# Altium schematic sheet ESP32-S3.SchDoc
size A3; SheetNumber: 2; SheetTotal: 12
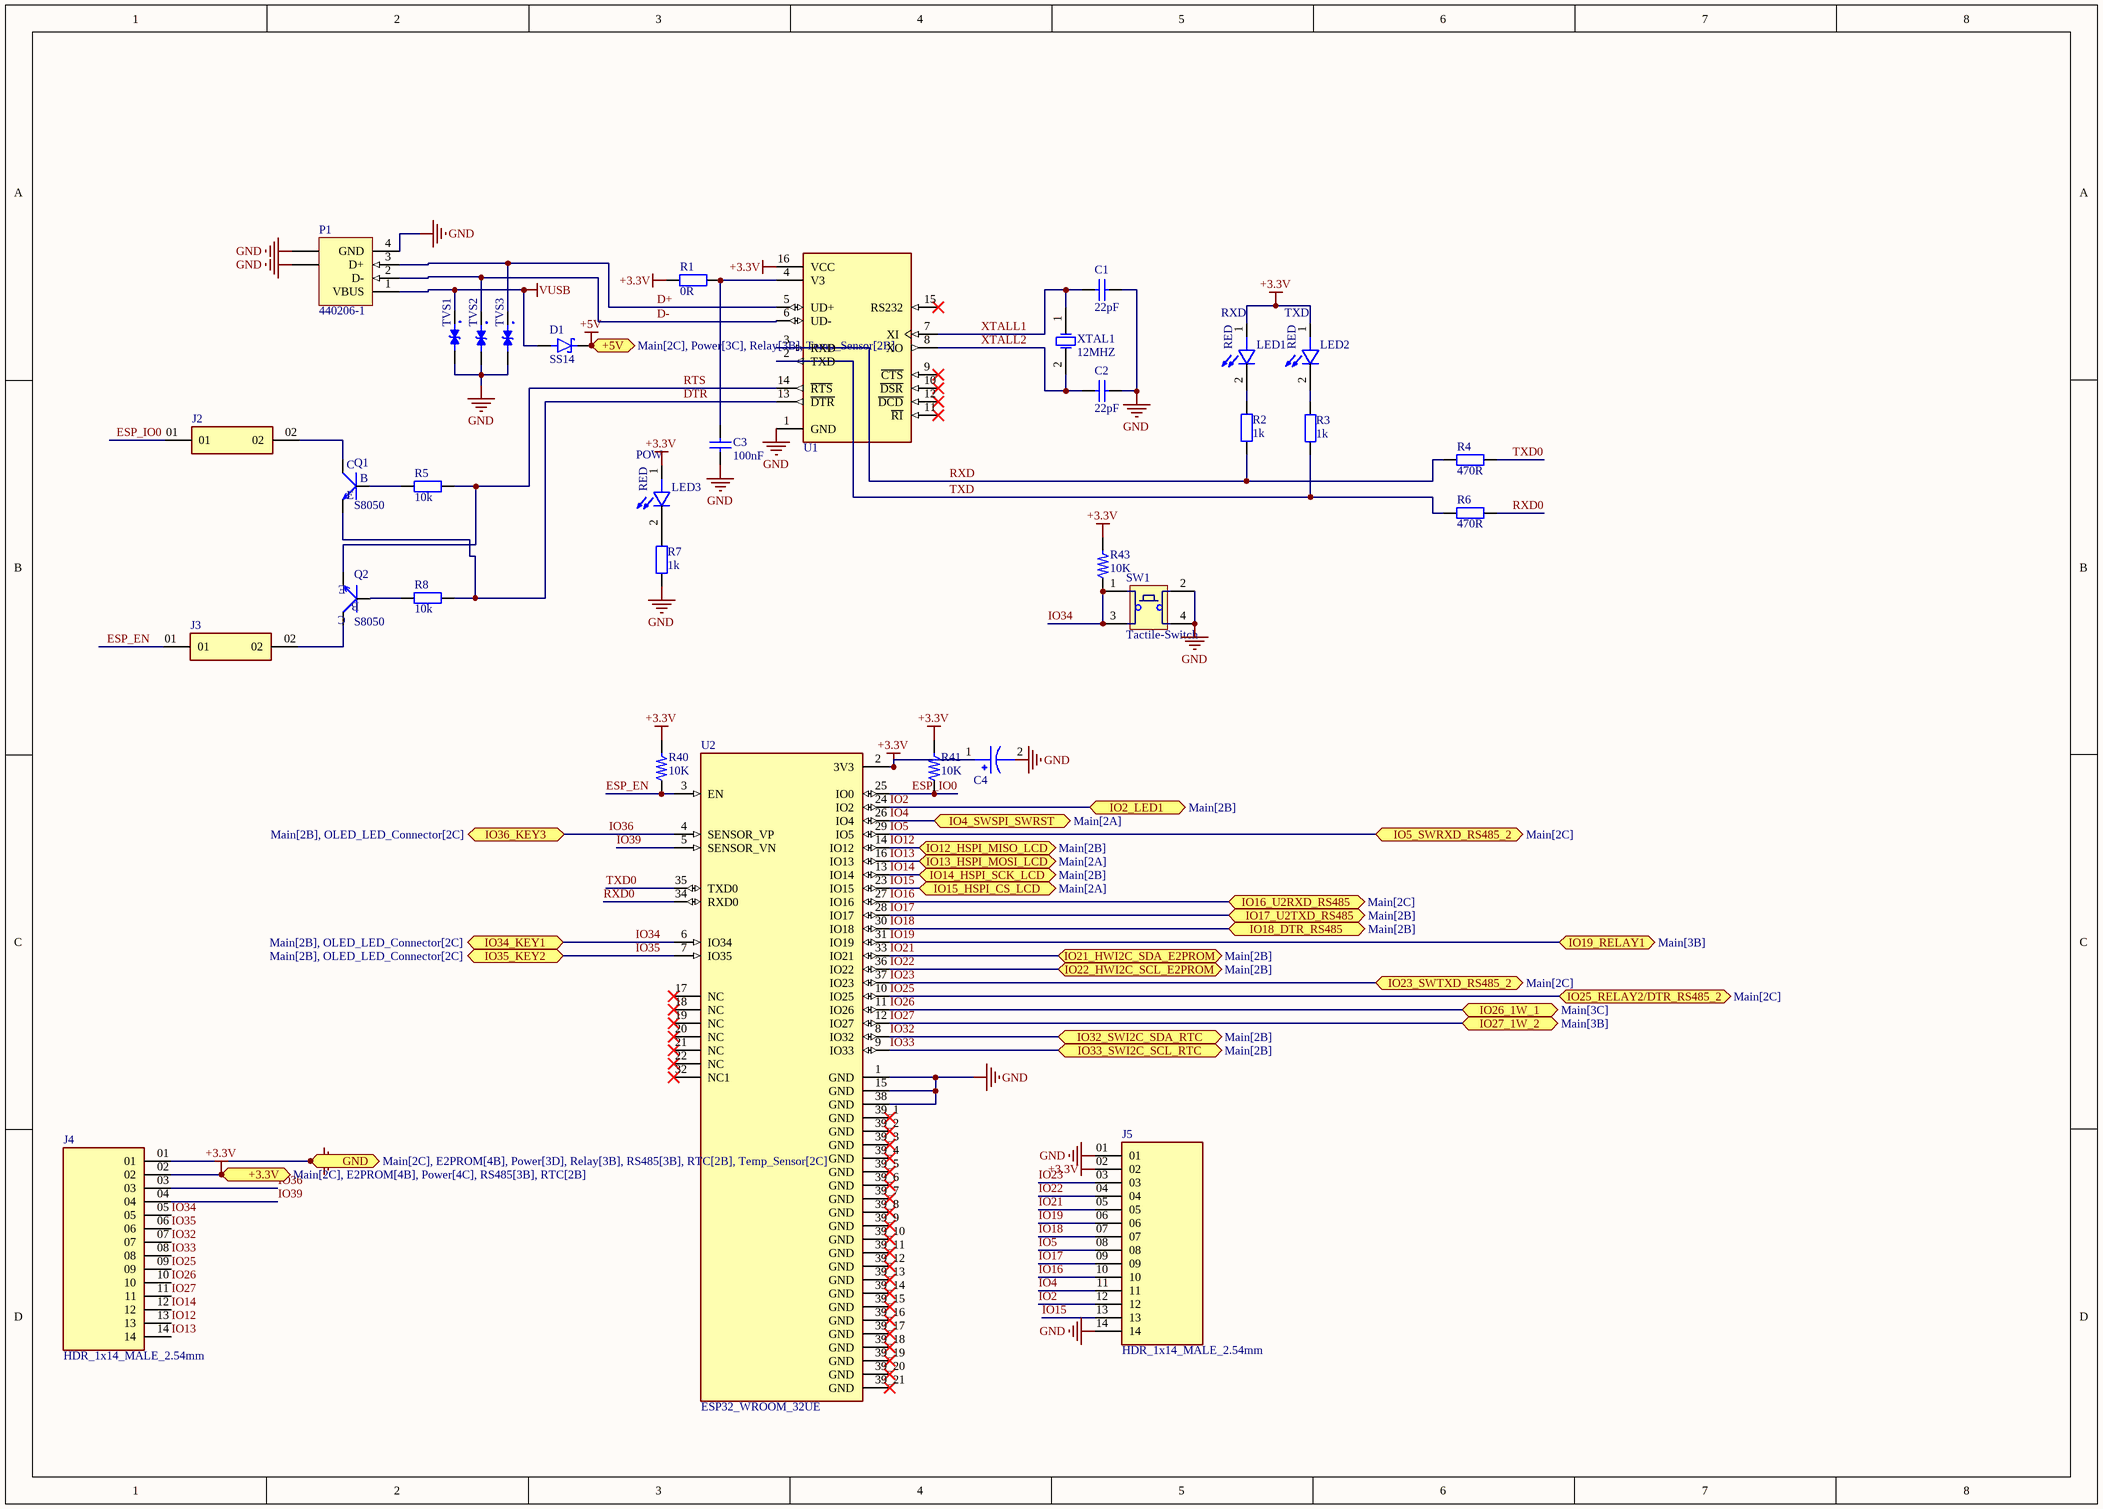
[diagram p0: ESP32-S3.SchDoc]

## Parts
C1  22pF  [0805]
C2  22pF  [0805]
C3  100nF  [0805]
C4  100uf 10V TAN  [TAN_SIZE_A]  (value not drawn)
D1  SS14  [SS14]
J2  HDR_1x2_MALE_2.54mm  [HDR_1x2_MALE_2.54mm]  (value not drawn)
J3  HDR_1x2_MALE_2.54mm  [HDR_1x2_MALE_2.54mm]  (value not drawn)
J4  HDR_1x14_MALE_2.54mm  [HDR_1x14_MALE_2.54mm]
J5  HDR_1x14_MALE_2.54mm  [HDR_1x14_MALE_2.54mm]
LED1  RXD  [LED-0805-G]
LED2  TXD  [LED-0805-G]
LED3  POW  [LED-0805-G]
P1  440206-1  [USB]
Q1  S8050  [S8050]
Q2  S8050  [S8050]
R1  0R  [R0805]
R2  1k  [R0805]
R3  1k  [R0805]
R4  470R  [R0805]
R5  10k  [R0805]
R6  470R  [R0805]
R7  1k  [R0805]
R8  10k  [R0805]
R40  10K  [R0805]
R41  10K  [R0805]
R43  10K  [R0805]
SW1  Tactile-Switch  [SW-Tactile-SMD]
TVS1  LESD5D5.0CT1G  [TVS]  (value not drawn)
TVS2  LESD5D5.0CT1G  [TVS]  (value not drawn)
TVS3  LESD5D5.0CT1G  [TVS]  (value not drawn)
U1  CH340G  [CH340G]  (value not drawn)
U2  ESP32_WROOM_32UE  [ESP32_WROOM_32UE(M113EH6400UH3Q0)]
XTAL1  12MHZ  [XTAL-1]

## Ports
+3.3V (bidir, see Main[2C], E2PROM[4B], Power[4C], RS485[3B], RTC[2B]), +5V (bidir, see Main[2C], Power[3C], Relay[3B], Temp_Sensor[2B]), GND (bidir, see Main[2C], E2PROM[4B], Power[3D], Relay[3B], RS485[3B], RTC[2B], Temp_Sensor[2C]), IO2_LED1 (bidir, see Main[2B]), IO4_SWSPI_SWRST (bidir, see Main[2A]), IO5_SWRXD_RS485_2 (bidir, see Main[2C]), IO12_HSPI_MISO_LCD (bidir, see Main[2B]), IO13_HSPI_MOSI_LCD (bidir, see Main[2A]), IO14_HSPI_SCK_LCD (bidir, see Main[2B]), IO15_HSPI_CS_LCD (bidir, see Main[2A]), IO16_U2RXD_RS485 (bidir, see Main[2C]), IO17_U2TXD_RS485 (bidir, see Main[2B]), IO18_DTR_RS485 (bidir, see Main[2B]), IO19_RELAY1 (bidir, see Main[3B]), IO21_HWI2C_SDA_E2PROM (bidir, see Main[2B]), IO22_HWI2C_SCL_E2PROM (bidir, see Main[2B]), IO23_SWTXD_RS485_2 (bidir, see Main[2C]), IO25_RELAY2/DTR_RS485_2 (bidir, see Main[2C]), IO26_1W_1 (bidir, see Main[3C]), IO27_1W_2 (bidir, see Main[3B]), IO32_SWI2C_SDA_RTC (bidir, see Main[2B]), IO33_SWI2C_SCL_RTC (bidir, see Main[2B]), IO34_KEY1 (bidir, see Main[2B], OLED_LED_Connector[2C]), IO35_KEY2 (bidir, see Main[2B], OLED_LED_Connector[2C]), IO36_KEY3 (bidir, see Main[2B], OLED_LED_Connector[2C])

## Nets
+3.3V: C4.1 J4.02 J5.02 LED1.1 LED2.1 LED3.1 R1.1 R40.2 R41.2 R43.2 U1.16(VCC) U2.2(3V3) ; port +3.3V
+5V: D1.C(K) ; port +5V
GND: C1.1 C2.1 C3.1 C4.2 J4.01 J5.01 J5.14 P1.4(GND) P1.5(SHLD) P1.6(SHLD) R7.2 SW1.2 SW1.4 TVS1.2 TVS2.2 TVS3.2 U1.1(GND) U2.1(GND) U2.15(GND) U2.38(GND) ; port GND
VUSB: D1.A P1.1(VBUS) TVS1.1
D+: P1.3(D+) TVS3.1 U1.5(UD+)
D-: P1.2(D-) TVS2.1 U1.6(UD-)
DTR: Q1.2(E) R8.1 U1.13(~{DTR})
ESP_EN: J3.01 R40.1 U2.3(EN)
ESP_IO0: J2.01 R41.1 U2.25(IO0)
IO2: J5.12 U2.24(IO2) ; port IO2_LED1
IO4: J5.11 U2.26(IO4) ; port IO4_SWSPI_SWRST
IO5: J5.08 U2.29(IO5) ; port IO5_SWRXD_RS485_2
IO12: J4.13 U2.14(IO12) ; port IO12_HSPI_MISO_LCD
IO13: J4.14 U2.16(IO13) ; port IO13_HSPI_MOSI_LCD
IO14: J4.12 U2.13(IO14) ; port IO14_HSPI_SCK_LCD
IO15: J5.13 U2.23(IO15) ; port IO15_HSPI_CS_LCD
IO16: J5.10 U2.27(IO16) ; port IO16_U2RXD_RS485
IO17: J5.09 U2.28(IO17) ; port IO17_U2TXD_RS485
IO18: J5.07 U2.30(IO18) ; port IO18_DTR_RS485
IO19: J5.06 U2.31(IO19) ; port IO19_RELAY1
IO21: J5.05 U2.33(IO21) ; port IO21_HWI2C_SDA_E2PROM
IO22: J5.04 U2.36(IO22) ; port IO22_HWI2C_SCL_E2PROM
IO23: J5.03 U2.37(IO23) ; port IO23_SWTXD_RS485_2
IO25: J4.09 U2.10(IO25) ; port IO25_RELAY2/DTR_RS485_2
IO26: J4.10 U2.11(IO26) ; port IO26_1W_1
IO27: J4.11 U2.12(IO27) ; port IO27_1W_2
IO32: J4.07 U2.8(IO32) ; port IO32_SWI2C_SDA_RTC
IO33: J4.08 U2.9(IO33) ; port IO33_SWI2C_SCL_RTC
IO34: J4.05 R43.1 SW1.1 SW1.3 U2.6(IO34) ; port IO34_KEY1
IO35: J4.06 U2.7(IO35) ; port IO35_KEY2
IO36: J4.03 U2.4(SENSOR_VP) ; port IO36_KEY3
IO39: J4.04 U2.5(SENSOR_VN)
RTS: Q2.2(E) R5.1 U1.14(~{RTS})
RXD: R2.2 R4.1 U1.3(RXD)
RXD0: R6.2 U2.34(RXD0)
TXD: R3.2 R6.1 U1.2(TXD)
TXD0: R4.2 U2.35(TXD0)
XTALL1: C1.2 U1.7(XI) XTAL1.1(OSC1)
XTALL2: C2.2 U1.8(XO) XTAL1.2(OSC2)
NetC3_2: C3.2 R1.2 U1.4(V3)
NetJ2_02: J2.02 Q1.3(C)
NetJ3_02: J3.02 Q2.3(C)
NetLED1_2: LED1.2 R2.1
NetLED2_2: LED2.2 R3.1
NetLED3_2: LED3.2 R7.1
NetQ1_1: Q1.1(B) R5.2
NetQ2_1: Q2.1(B) R8.2

Not connected (* = marked no-connect by the designer): U1 9(~{CTS})* 10(~{DSR})* 11(~{RI})* 12(~{DCD})* 15(RS232)*; U2 17(NC)* 18(NC)* 19(NC)* 20(NC)* 21(NC)* 22(NC)* 32(NC1)* 39_1(GND)* 39_2(GND)* 39_3(GND)* 39_4(GND)* 39_5(GND)* 39_6(GND)* 39_7(GND)* 39_8(GND)* 39_9(GND)* 39_10(GND)* 39_11(GND)* 39_12(GND)* 39_13(GND)* 39_14(GND)* 39_15(GND)* 39_16(GND)* 39_17(GND)* 39_18(GND)* 39_19(GND)* 39_20(GND)* 39_21(GND)*

## Notes on the sheet
- (in symbol LED_0805) RED

## Library data of the parts
C1 C2 = 2-Cap_4: Bipolar Capacitor; Type: MKT
C3 = Cap_2: Capacitor; Published: 8-Jun-2000; LatestRevisionDate: 17-Jul-2002; LatestRevisionNote: Re-released for DXP Platform.; PackageReference: RAD-0.3; Publisher: Altium Limited
LED1-LED3 = LED_0805
P1 = 440206-1: USB 1.1, Vertical, Thru-Hole, B Type, Receptacle, 4 Position, White; ContactMaterial: Copper Alloy; ContactPlating: Gold (30) over Nickel; TerminationLength: 2.84mm [0.112in.]; PCB_Layout: Complies with manufacturer's recommendation.; DrillSize: Corresponds to nominal value.; PanelGround: Without; Published: 15-Jul-2004; DatasheetDocument: 04-May-2001; PackageDocument: 04-May-2001; PackageReference: 440206; Publisher: Altium Limited; HousingMaterial: Thermoplastic; ComponentLink1Description: Manufacturer Link; ComponentLink1URL: http://www.tycoelectronics.com/; ComponentLink2Description: Packaging Specification; ComponentLink2URL: http://ecommas.tycoelectronics.com/commerce/DocumentDelivery/DDEController?Action=showdoc&DocId=Customer+Drawing%7F440206%7FA%7Ftif%7FEnglish%7FC_440206_A.tif
R1-R8 = Res2: Resistor; Published: 8-Jun-2000; LatestRevisionDate: 17-Jul-2002; LatestRevisionNote: Re-released for DXP Platform.; PackageReference: AXIAL-0.4; Publisher: Altium Limited
R40 R41 R43 = myRes_1: Value: 10K
TVS1-TVS3 = TVS 5V
U1 = CH340G: USB to Serial Converter
XTAL1 = XTAL: Crystal Oscillator; Published: 8-Jun-2000; LatestRevisionDate: 17-Jul-2002; LatestRevisionNote: Re-released for DXP Platform.; PackageReference: R38; Publisher: Altium Limited